# EasyEDA schematic blinky-555.schematic.json
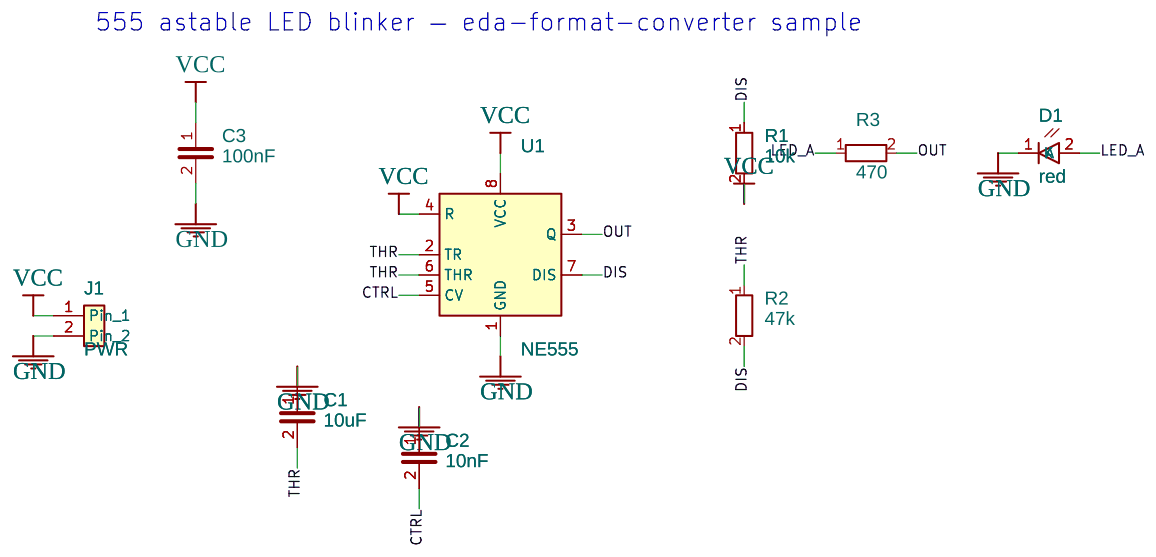
[diagram p0: schematic sheet]

## Parts
C1  10uF  [C_0805_2012Metric]
C2  10nF  [C_0805_2012Metric]
C3  100nF  [C_0603_1608Metric]
D1  red  [LED_0805_2012Metric]
J1  PWR  [PinHeader_1x02_P2.54mm_Vertical]
R1  10k  [R_0805_2012Metric]
R2  47k  [R_0805_2012Metric]
R3  470  [R_0805_2012Metric]
U1  NE555  [SOIC-8_3.9x4.9mm_P1.27mm]

## Nets
GND: C1.1 C2.1 C3.2 D1.1(K) J1.2(Pin) U1.1(GND)
VCC: C3.1 J1.1(Pin) R1.2 U1.4(R) U1.8(VCC)
CTRL: C2.2 U1.5(CV)
DIS: R1.1 R2.2 U1.7(DIS)
LED_A: D1.2(A) R3.1
OUT: R3.2 U1.3(Q)
THR: C1.2 R2.1 U1.2(TR) U1.6(THR)

## Notes on the sheet
- 555 astable LED blinker — eda-format-converter sample
